# Altium schematic sheet A3P600_4Bit_CPU.SchDoc
size 589 x 419 mm; SheetNumber: 1; SheetTotal: 1
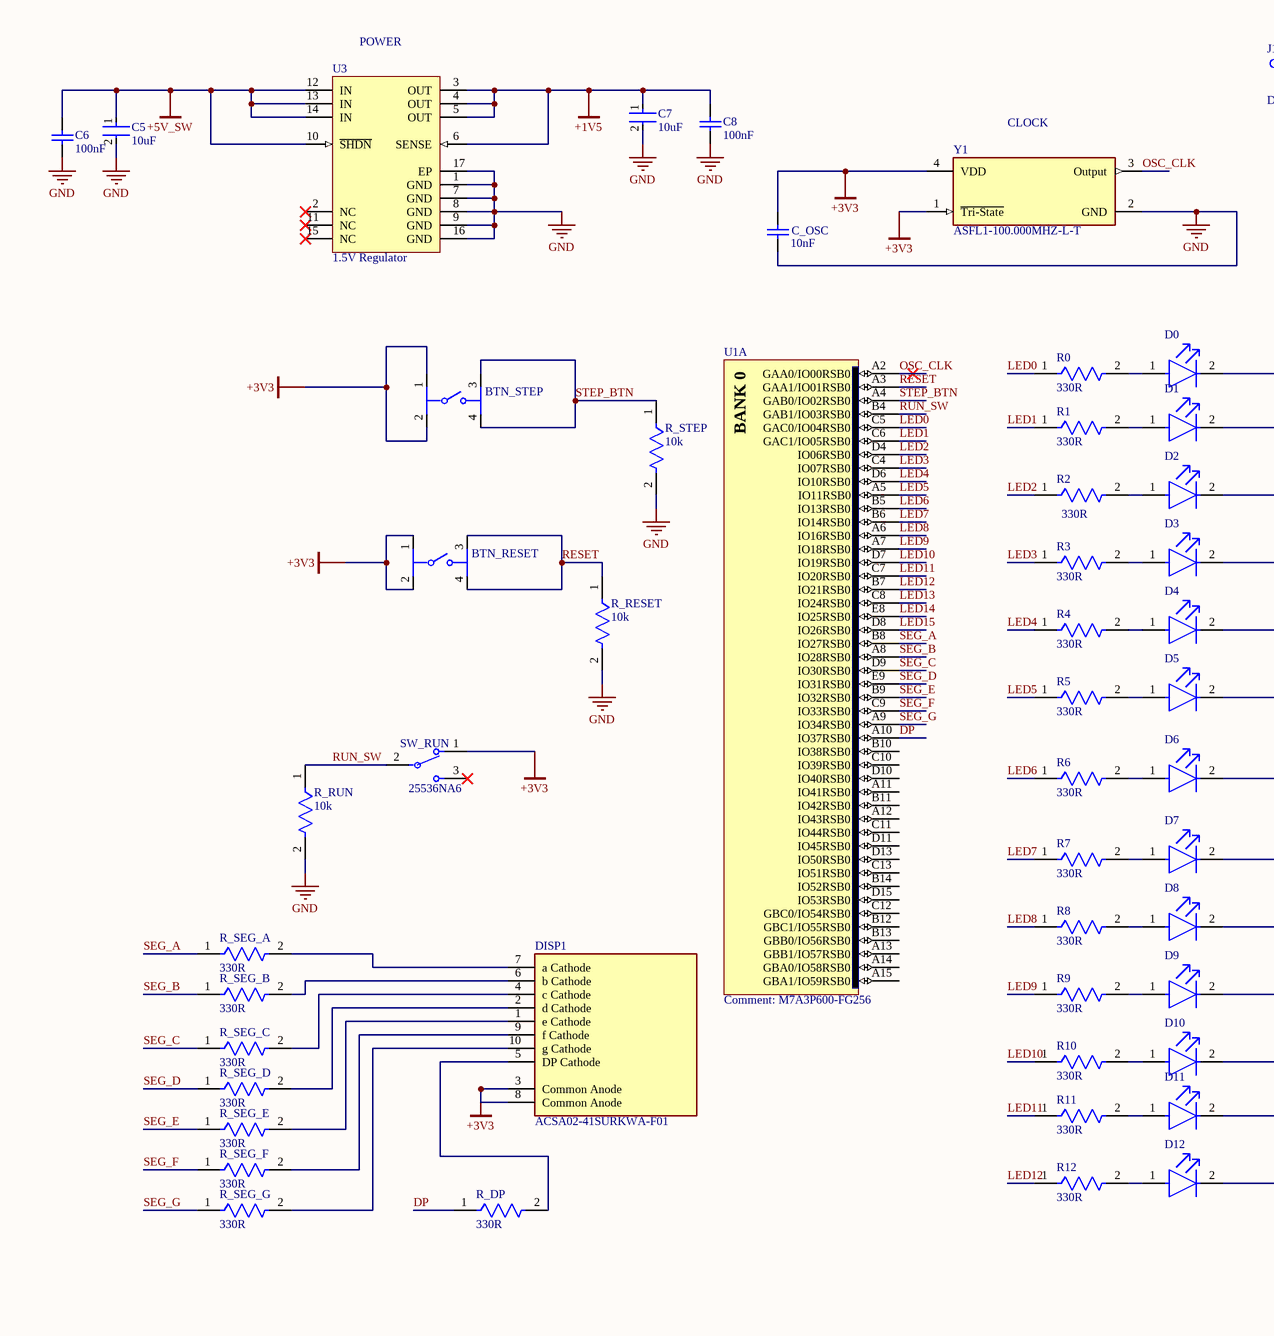
[diagram p0: A3P600_4Bit_CPU.SchDoc, left]
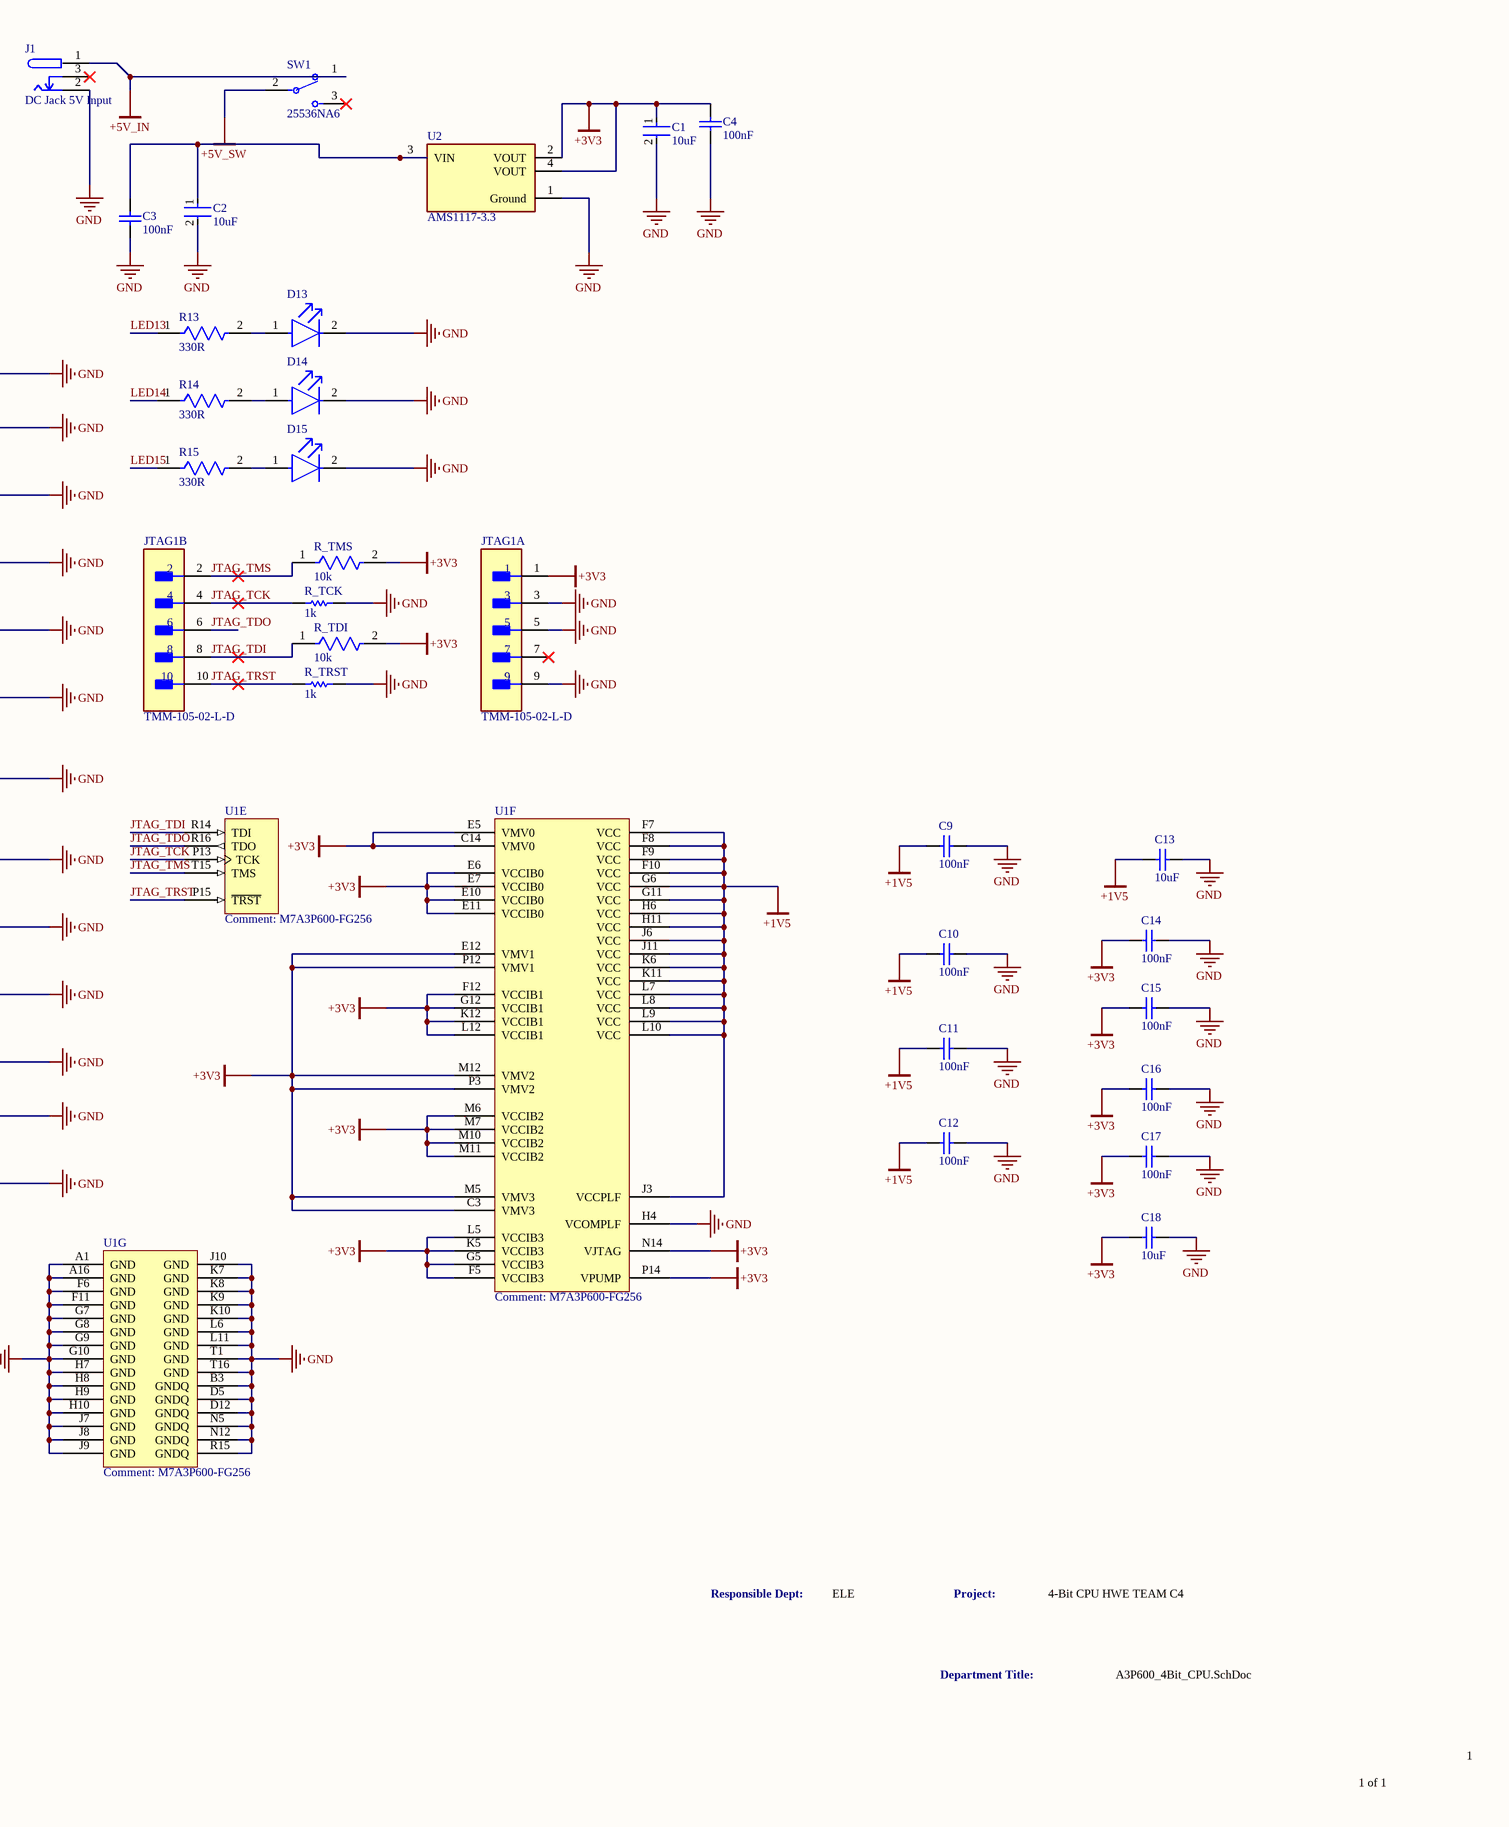
[diagram p1: A3P600_4Bit_CPU.SchDoc, right]

## Parts
BTN_RESET  B3W-1000  [FP-B3W-1000-MFG]  (value not drawn)
BTN_STEP  B3W-1000  [FP-B3W-1000-MFG]  (value not drawn)
C1  10uF  [FP-1206-L_3_2_0_3-W_1_6_0-IPC_B]
C2  10uF  [FP-1206-L_3_2_0_3-W_1_6_0-IPC_B]
C3  100nF  [CAPC2013X145X50NL20T25]
C4  100nF  [CAPC2013X145X50NL20T25]
C5  10uF  [FP-1206-L_3_2_0_3-W_1_6_0-IPC_B]
C6  100nF  [CAPC2013X145X50NL20T25]
C7  10uF  [FP-1206-L_3_2_0_3-W_1_6_0-IPC_B]
C8  100nF  [CAPC2013X145X50NL20T25]
C9  100nF  [CAPC0805(2012)100_L]
C10  100nF  [CAPC0805(2012)100_L]
C11  100nF  [CAPC0805(2012)100_L]
C12  100nF  [CAPC0805(2012)100_L]
C13  10uF  [CAPC2013X140X50LL20T25]
C14  100nF  [CAPC0805(2012)100_L]
C15  100nF  [CAPC0805(2012)100_L]
C16  100nF  [CAPC0805(2012)100_L]
C17  100nF  [CAPC0805(2012)100_L]
C18  10uF  [CAPC2013X140X50LL20T25]
C_OSC  10nF  [CAPC2013X94X50ML20T25]
D0  SML-LX0805SRC-TR  [FP-SML-LX0805SRC-TR-MFG]  (value not drawn)
D1  SML-LX0805SRC-TR  [FP-SML-LX0805SRC-TR-MFG]  (value not drawn)
D2  SML-LX0805SRC-TR  [FP-SML-LX0805SRC-TR-MFG]  (value not drawn)
D3  SML-LX0805SRC-TR  [FP-SML-LX0805SRC-TR-MFG]  (value not drawn)
D4  SML-LX0805SRC-TR  [FP-SML-LX0805SRC-TR-MFG]  (value not drawn)
D5  SML-LX0805SRC-TR  [FP-SML-LX0805SRC-TR-MFG]  (value not drawn)
D6  SML-LX0805SRC-TR  [FP-SML-LX0805SRC-TR-MFG]  (value not drawn)
D7  SML-LX0805SRC-TR  [FP-SML-LX0805SRC-TR-MFG]  (value not drawn)
D8  SML-LX0805SRC-TR  [FP-SML-LX0805SRC-TR-MFG]  (value not drawn)
D9  SML-LX0805SRC-TR  [FP-SML-LX0805SRC-TR-MFG]  (value not drawn)
D10  SML-LX0805SRC-TR  [FP-SML-LX0805SRC-TR-MFG]  (value not drawn)
D11  SML-LX0805SRC-TR  [FP-SML-LX0805SRC-TR-MFG]  (value not drawn)
D12  SML-LX0805SRC-TR  [FP-SML-LX0805SRC-TR-MFG]  (value not drawn)
D13  SML-LX0805SRC-TR  [FP-SML-LX0805SRC-TR-MFG]  (value not drawn)
D14  SML-LX0805SRC-TR  [FP-SML-LX0805SRC-TR-MFG]  (value not drawn)
D15  SML-LX0805SRC-TR  [FP-SML-LX0805SRC-TR-MFG]  (value not drawn)
DISP1  ACSA02-41SURKWA-F01  [FP-ACSA02-41SURKWA-F01-MFG]
J1  DC Jack 5V Input  [FP-PJ-102A-MFG]
JTAG1  TMM-105-02-L-D  [FP-TMM-105-02-L-D-MFG]  (parts A,B of 2)
R0  330R  [FP-CRCW0805-e3-IPC_C]
R1  330R  [FP-CRCW0805-e3-IPC_C]
R2  330R  [FP-CRCW0805-e3-IPC_C]
R3  330R  [FP-CRCW0805-e3-IPC_C]
R4  330R  [FP-CRCW0805-e3-IPC_C]
R5  330R  [FP-CRCW0805-e3-IPC_C]
R6  330R  [FP-CRCW0805-e3-IPC_C]
R7  330R  [FP-CRCW0805-e3-IPC_C]
R8  330R  [FP-CRCW0805-e3-IPC_C]
R9  330R  [FP-CRCW0805-e3-IPC_C]
R10  330R  [FP-CRCW0805-e3-IPC_C]
R11  330R  [FP-CRCW0805-e3-IPC_C]
R12  330R  [FP-CRCW0805-e3-IPC_C]
R13  330R  [FP-CRCW0805-e3-IPC_C]
R14  330R  [FP-CRCW0805-e3-IPC_C]
R15  330R  [FP-CRCW0805-e3-IPC_C]
R_DP  330R  [FP-RT0805-MFG]
R_RESET  10k  [FP-CRGP0805-IPC_C]
R_RUN  10k  [FP-CRGCQ1206-IPC_C]
R_SEG_A  330R  [FP-RT0805-MFG]
R_SEG_B  330R  [FP-RT0805-MFG]
R_SEG_C  330R  [FP-RT0805-MFG]
R_SEG_D  330R  [FP-RT0805-MFG]
R_SEG_E  330R  [FP-RT0805-MFG]
R_SEG_F  330R  [FP-RT0805-MFG]
R_SEG_G  330R  [FP-RT0805-MFG]
R_STEP  10k  [FP-CRGP0805-IPC_C]
R_TCK  1k  [RESC2013X50X30ML20T20]
R_TDI  10k  [FP-CRGP0805-IPC_C]
R_TMS  10k  [FP-CRGP0805-IPC_C]
R_TRST  1k  [RESC2013X50X30ML20T20]
SW1  25536NA6  [FP-25536NA6-0]
SW_RUN  25536NA6  [FP-25536NA6-0]
U1  M7A3P600-FG256  [FG256]  (parts A,E,F,G of 7)
U2  AMS1117-3.3  [FP-AMS1117-IPC_C]
U3  1.5V Regulator  [LT-FE-16-EPV-BB_L]
Y1  ASFL1-100.000MHZ-L-T  [FP-ASFL1-MFG]

## Nets
+1V5: C7.1 C8.1 C9.1 C10.1 C11.1 C12.2 C13.1 U1.F7(VCC) U1.F8(VCC) U1.F9(VCC) U1.F10(VCC) U1.G6(VCC) U1.G11(VCC) U1.H6(VCC) U1.H11(VCC) U1.J3(VCCPLF) U1.J6(VCC) U1.J11(VCC) U1.K6(VCC) U1.K11(VCC) U1.L7(VCC) U1.L8(VCC) U1.L9(VCC) U1.L10(VCC) U3.3(OUT) U3.4(OUT) U3.5(OUT) U3.6(SENSE)
+3V3: BTN_RESET.1 BTN_RESET.2 BTN_STEP.1 BTN_STEP.2 C1.1 C4.2 C14.1 C15.1 C16.1 C17.1 C18.1 C_OSC.1 DISP1.3(Common_Anode) DISP1.8(Common_Anode) JTAG1.1 R_TDI.2 R_TMS.2 SW_RUN.1 U1.C3(VMV3) U1.C14(VMV0) U1.E5(VMV0) U1.E6(VCCIB0) U1.E7(VCCIB0) U1.E10(VCCIB0) U1.E11(VCCIB0) U1.E12(VMV1) U1.F5(VCCIB3) U1.F12(VCCIB1) U1.G5(VCCIB3) U1.G12(VCCIB1) U1.K5(VCCIB3) U1.K12(VCCIB1) U1.L5(VCCIB3) U1.L12(VCCIB1) U1.M5(VMV3) U1.M6(VCCIB2) U1.M7(VCCIB2) U1.M10(VCCIB2) U1.M11(VCCIB2) U1.M12(VMV2) U1.N14(VJTAG) U1.P3(VMV2) U1.P12(VMV1) U1.P14(VPUMP) U2.2(VOUT) U2.4(VOUT) Y1.1(~{Tri-State}) Y1.4(VDD)
+5V_IN: J1.1 SW1.1
+5V_SW: C5.1 C6.1 SW1.2 U3.10(~{SHDN}) U3.12(IN) U3.13(IN) U3.14(IN)
GND: C1.2 C2.2 C3.2 C4.1 C5.2 C6.2 C7.2 C8.2 C9.2 C10.2 C11.2 C12.1 C13.2 C14.2 C15.2 C16.2 C17.2 C18.2 C_OSC.2 D0.2(C) D1.2(C) D2.2(C) D3.2(C) D4.2(C) D5.2(C) D6.2(C) D7.2(C) D8.2(C) D9.2(C) D10.2(C) D11.2(C) D12.2(C) D13.2(C) D14.2(C) D15.2(C) J1.2 JTAG1.3 JTAG1.5 JTAG1.9 R_RESET.2 R_RUN.2 R_STEP.2 R_TCK.2 R_TRST.2 U1.A1(GND) U1.A16(GND) U1.B3(GNDQ) U1.D5(GNDQ) U1.D12(GNDQ) U1.F6(GND) U1.F11(GND) U1.G7(GND) U1.G8(GND) U1.G9(GND) U1.G10(GND) U1.H4(VCOMPLF) U1.H7(GND) U1.H8(GND) U1.H9(GND) U1.H10(GND) U1.J7(GND) U1.J8(GND) U1.J9(GND) U1.J10(GND) U1.K7(GND) U1.K8(GND) U1.K9(GND) U1.K10(GND) U1.L6(GND) U1.L11(GND) U1.N5(GNDQ) U1.N12(GNDQ) U1.R15(GNDQ) U1.T1(GND) U1.T16(GND) U2.1(Ground) U3.1(GND) U3.7(GND) U3.8(GND) U3.9(GND) U3.16(GND) U3.17(EP) Y1.2(GND)
DP: R_DP.1 U1.A10(IO37RSB0)
JTAG_TCK: JTAG1.4 R_TCK.1 U1.P13(TCK)
JTAG_TDI: JTAG1.8 R_TDI.1 U1.R14(TDI)
JTAG_TDO: JTAG1.6 U1.R16(TDO)
JTAG_TMS: JTAG1.2 R_TMS.1 U1.T15(TMS)
JTAG_TRST: JTAG1.10 R_TRST.1 U1.P15(~{TRST})
LED0: R0.1 U1.C5(GAC0/IO04RSB0)
LED1: R1.1 U1.C6(GAC1/IO05RSB0)
LED2: R2.1 U1.D4(IO06RSB0)
LED3: R3.1 U1.C4(IO07RSB0)
LED4: R4.1 U1.D6(IO10RSB0)
LED5: R5.1 U1.A5(IO11RSB0)
LED6: R6.1 U1.B5(IO13RSB0)
LED7: R7.1 U1.B6(IO14RSB0)
LED8: R8.1 U1.A6(IO16RSB0)
LED9: R9.1 U1.A7(IO18RSB0)
LED10: R10.1 U1.D7(IO19RSB0)
LED11: R11.1 U1.C7(IO20RSB0)
LED12: R12.1 U1.B7(IO21RSB0)
LED13: R13.1 U1.C8(IO24RSB0)
LED14: R14.1 U1.E8(IO25RSB0)
LED15: R15.1 U1.D8(IO26RSB0)
OSC_CLK: U1.A2(GAA0/IO00RSB0) Y1.3(Output)
RESET: BTN_RESET.3 BTN_RESET.4 R_RESET.1 U1.A3(GAA1/IO01RSB0)
RUN_SW: R_RUN.1 SW_RUN.2 U1.B4(GAB1/IO03RSB0)
SEG_A: R_SEG_A.1 U1.B8(IO27RSB0)
SEG_B: R_SEG_B.1 U1.A8(IO28RSB0)
SEG_C: R_SEG_C.1 U1.D9(IO30RSB0)
SEG_D: R_SEG_D.1 U1.E9(IO31RSB0)
SEG_E: R_SEG_E.1 U1.B9(IO32RSB0)
SEG_F: R_SEG_F.1 U1.C9(IO33RSB0)
SEG_G: R_SEG_G.1 U1.A9(IO34RSB0)
STEP_BTN: BTN_STEP.3 BTN_STEP.4 R_STEP.1 U1.A4(GAB0/IO02RSB0)
NetC2_1: C2.1 C3.1 U2.3(VIN)
NetD0_1: D0.1(A) R0.2
NetD1_1: D1.1(A) R1.2
NetD2_1: D2.1(A) R2.2
NetD3_1: D3.1(A) R3.2
NetD4_1: D4.1(A) R4.2
NetD5_1: D5.1(A) R5.2
NetD6_1: D6.1(A) R6.2
NetD7_1: D7.1(A) R7.2
NetD8_1: D8.1(A) R8.2
NetD9_1: D9.1(A) R9.2
NetD10_1: D10.1(A) R10.2
NetD11_1: D11.1(A) R11.2
NetD12_1: D12.1(A) R12.2
NetD13_1: D13.1(A) R13.2
NetD14_1: D14.1(A) R14.2
NetD15_1: D15.1(A) R15.2
NetDISP1_1: DISP1.1(e_Cathode) R_SEG_E.2
NetDISP1_2: DISP1.2(d_Cathode) R_SEG_D.2
NetDISP1_4: DISP1.4(c_Cathode) R_SEG_C.2
NetDISP1_5: DISP1.5(DP_Cathode) R_DP.2
NetDISP1_6: DISP1.6(b_Cathode) R_SEG_B.2
NetDISP1_7: DISP1.7(a_Cathode) R_SEG_A.2
NetDISP1_9: DISP1.9(f_Cathode) R_SEG_F.2
NetDISP1_10: DISP1.10(g_Cathode) R_SEG_G.2

Not connected (* = marked no-connect by the designer): J1 3*; JTAG1 7*; SW1 3*; SW_RUN 3*; U1 A11(IO41RSB0) A12(IO43RSB0) A13(GBB1/IO57RSB0) A14(GBA0/IO58RSB0) A15(GBA1/IO59RSB0) B10(IO38RSB0) B11(IO42RSB0) B12(GBC1/IO55RSB0) B13(GBB0/IO56RSB0) B14(IO52RSB0) C10(IO39RSB0) C11(IO44RSB0) C12(GBC0/IO54RSB0) C13(IO51RSB0) D10(IO40RSB0) D11(IO45RSB0) D13(IO50RSB0) D15(IO53RSB0); U3 2(NC)* 11(NC)* 15(NC)*

## Notes on the sheet
- (near U3) POWER
- (near Y1) CLOCK
- Responsible Dept:
- ELE
- Project:
- 4-Bit CPU HWE TEAM C4
- Department Title:
- A3P600_4Bit_CPU.SchDoc
- 1 of 1
- 1
- (in symbol CMP-0097-00122-1, part A) BANK 0

## Library data of the parts
BTN_RESET BTN_STEP = CMP-08834-000045-1: SWITCH TACTILE SPST-NO 0.05A 24V; Actuator Color: White; Actuator Type: Standard; Current Rating: 50mA; Ratings: IP67; Number of Poles: 1; Illumination Type: Non-Illuminated; Actuator Length: 0.9mm; Switch Function: Off-Mom; Mechanical Life: 1000000Cycles; Throw Configuration: SPST; Operating Force: 1.57N; Contact Resistance: 100mR; Switch Travel: 0.25mm; Mount: Through Hole; Orientation: Straight; Termination: PC Pins; Series: B3W; Max Operating Temperature: 70°C; Contact Plating: Silver; Max Current Rating: 50mA; RoHS Compliant: Yes; Packaging: Bulk; Contact Material: Silver; Length: 6.6mm; Voltage Rating (DC): 24V; Min Operating Temperature: -25°C; Radiation Hardening: No; Package Quantity: 100; Depth: 6.6mm; Max Voltage Rating (DC): 24V; Weight: 0.3g; Insulation Resistance: 100MR; Contact Current Rating: 50mA
C1 C2 C5 C7 = CMP-2000-07359-3: None; Voltage Rating: 50V; Tolerance: 20%; Dielectric: X5R; Package Quantity: 2000; Capacitance: 10uF; Min Operating Temperature: -55°C; Halogen Free: Halogen Free; Width: 0.063inch; Case Code (Imperial): 1206; RoHS Compliant: Yes; Packaging: Tape and Reel; Case Code (Metric): 3216; Height: 1.6mm; Construction: Flat; Length: 0.126inch; Thickness: 0.075inch; Termination: SMD/SMT; Mount: Surface Mount; Series: M; Case/Package: 1206; Voltage Rating (DC): 50V; Max Operating Temperature: 85°C
C3 C4 C6 C8 = CMP-2007-01227-1: Manufacturer: Kemet; Part Number: C0805S104K5RACTU
C9-C12 C14-C17 = CMP-1036-04418-1: CAP 100nF 50V ±5% 0805 (2012 Metric) Thickness 1mm SMD; Case-EIA: 0805; Tolerance: Â±5%; Case-Metric: 2012; Max Thickness: 1 mm; Technology: SMT; Value: 100nF; Rated Voltage: 50 V
C13 C18 = CMP-1036-04929-2: Part Number: 0805YD106MAT2A; Manufacturer: AVX Interconnect / Elco
C_OSC = CMP-2007-04168-1: Manufacturer: AVX Interconnect / Elco; Part Number: 08051C103KAT4A
D0-D15 = CMP-57192-000013-1: LED RED CLEAR SMD; Forward Current: 20mA; Wavelength: 660nm; Forward Voltage: 1.7V; Luminous Intensity: 25mcd; Number of LEDs: 1; Current Rating: 25mA; Lens Color: Colorless; Power Rating: 100mW; Viewing Angle: 140°; Approvals: UL; Lens Transparency: Clear; Series: -; Package Quantity: 3000; Mount: Surface Mount; Lead Free: Lead Free; Case/Package: 0805; Max Operating Temperature: 85°C; Illumination Color: Red; Packaging: Tape and Reel; Length: 2mm; Lens Style: Clear; Width: 1.25mm; RoHS Compliant: Yes; Color: Red; Case Code (Metric): 2012; Dominant Wavelength: 660nm; Number of Pins: 2; Min Operating Temperature: -40°C; Case Code (Imperial): 0805; Voltage Rating (DC): 1.7V; Voltage Rating: 1.7V; Height: 1.2mm; Test Current: 20mA
DISP1 = CMP-44525-000003-1: DISPLAY 7-SEG 0.2" SGL RED 10SMD; Element Configuration: Common Anode; Forward Current: 30mA; Wavelength: 630nm; Operating Supply Voltage: 1.95V; Number of Characters: 1; Max Power Dissipation: 75mW; Luminous Intensity: 30mcd; Test Current: 20mA; Package Quantity: 650; Width: 0.272inch; Max Operating Temperature: 85°C; Case/Package: SMD/SMT; Illumination Color: Red; Min Operating Temperature: -40°C; Packaging: Tape and Reel; Power Consumption: 75mW; Forward Voltage: 1.95V; Color: Red; Height: 0.315inch
J1 = CMP-12637-106234071-1: PJ-102A 2.0 x 6.5 mm, 2.5 A, Horizontal, Through Hole, Tapered Pins, Dc Power Jack Connector; Voltage Rating (DC): 24V; Number of Contacts: 3; Outside Diameter: 6.5mm; Gender: Male; Shielding: No; Insulation Resistance: 50MΩ; Current Rating: 2.5A; Inside Diameter: 2mm; Number of Conductors: 2; Housing Color: Black; RoHS: Compliant; Diameter: 2.1mm; Mount: Through Hole; Contact Plating: Nickel; NexarPartId: 106234071; Voltage Rating: 24V; Housing Material: Thermoplastic; Max Operating Temperature: 85°C; Color: Black; Contact Material: Copper, Nickel, Tin; Orientation: Horizontal; Packaging: Bulk; Flammability Rating: UL94 V-0; Schedule B: 8536695050, 8536695050; Contact Gender: Male; Lead Free: Lead Free; Termination: Through Hole; Min Operating Temperature: -25°C; Height: 11.2mm; Lifecycle Status: Production
JTAG1 = CMP-02766-001571-1: CONN HEADER VERT 10POS 2MM; Max Voltage Rating (AC): 500V; Max Current Rating: 3.9A; Number of Positions: 10; Gender: Male; Radiation Hardening: No; Fastening Type: Pull; Housing Color: Black; Max Operating Temperature: 125°C; Number of Rows: 2; Series: TMM; Orientation: Straight; Insulation Color: Black; Contact Plating: Gold; Packaging: Bulk; Housing Material: Polymer; Contact Type: Male Pin; Contact Material: Bronze; Connector Type: Header; Termination: Solder; REACH SVHC: No SVHC; Contact Finish - Mating: GOLD; RoHS Compliant: Yes; Depth: 3.94mm; Min Operating Temperature: -55°C; Insulation Material: Polymer; Contact Shape: Square; Pitch: 2mm; Number of Contacts: 10; Length: 10mm; Lead Free: Lead Free
R0-R15 = CMP-2001-03824-2: RES Thick Film, 330Ω, 5%, 0.125W, 200ppm/°C, 0805; Power Rating: 125mW; Voltage Rating (DC): 150V; Case Code (Imperial): 0805; Temperature Coefficient: 200ppm/°C; Military Standard: Not; Tolerance: 5%; Max Power Dissipation: 125mW; Composition: Thick Film; Height: 0.02inch; Depth: 1.25mm; Termination: SMD/SMT; Voltage Rating: 150V; Max Operating Temperature: 155°C; Min Operating Temperature: -55°C; Number of Terminations: 2; Packaging: Tape and Reel; Radiation Hardening: No; Case/Package: 0805; Resistance: 330R; Lead Free: Lead Free; Package Quantity: 1; Contact Plating: Tin; Length: 2mm; Case Code (Metric): 2012; Features: Automotive AEC-Q200; Weight: 0.000194oz; Width: 0.049inch
R_DP R_SEG_A R_SEG_B R_SEG_C R_SEG_D R_SEG_E R_SEG_F R_SEG_G = CMP-2001-01631-2: RES 330 OHM 1/8W .1% SMD 0805; Manufacturer: Yageo; Manufacturer Part Number: RT0805BRD07330RL; Resistance: 330Ω; Temperature Coefficient: 25 ppm/°C; Value: 330Ω; Voltage Rating: 150V; Tolerance: 0.0025; Power Rating: 0.125W; Device Class L3: Chip SMD Resistors; Footprint Url: http://www.yageo.com/exep/pages/download/literatures/PYu-R_Mount_10.pdf; Device Class L2: Resistors; Series: RT; ComponentLink2Description: Datasheet; Automotive: No; Mouser Description: Thin Film Resistors - SMD 1/8W 330 ohm .1% 25ppm; Device Class L1: Passive Components; Digikey Description: RES 330 OHM 1/8W .1% SMD 0805; Ipc Land Pattern Name: RESC200125X50; Composition: Thin Film; Height: 0.6mm; RoHS: TRUE; Temperature: -55°C to +155°C; Category: Res; Package: RT0805; Octopart: https://octopart.com/rt0805brd07330rl-yageo-1374790; Temperature Range High: +155°C; ComponentLink2URL: http://www.yageo.com/documents/recent/PYu-RT_1-to-0.01_RoHS_L_9.pdf; Lead Free: Yes; Temperature Range Low: -55°C
R_RESET R_TDI R_TMS = CMP-03211-006861-1: CRGP 0805 10K 1%; Manufacturer Part Number: CRGP0805F10K; Manufacturer: TE; Power Rating: 0.33W; Voltage Rating: 150V; Value: 10KΩ; Tolerance: 0.01; Temperature Coefficient: ±100ppm/°C; ComponentLink2URL: https://www.mouser.com/datasheet/2/418/NG_DS_9-1773463-9_A-1358566.pdf; Temperature Range Low: -55°C; Ipc Land Pattern Name: RESC200125X55; Device Class L2: Resistors; Automotive: No; Device Class L3: Chip SMD Resistors; Composition: Thick Film; Temperature Range High: +155°C; Temperature: -55°C to +155°C; Height: 0.65mm; Series: CRGP; RoHS: TRUE; Device Class L1: Passive Components; Octopart: https://octopart.com/crgp0805f10k-te+connectivity-91018782; Package: CRGP0805; Digikey Description: CRGP 0805 10K 1%; Ambient Temperature Range High: +70°C; Lead Free: Yes; ComponentLink2Description: Datasheet; Category: Res; Resistance: 10KΩ
R_RUN = CMP-03211-010884-1: CRGCQ1206 10KΩ 0.25W 1% ±100ppm/°C 200V; Manufacturer: TE Connectivity; Manufacturer Part Number: CRGCQ1206F10K; Tolerance: 0.01; Automotive Grade: Grade 913; Value: 10KΩ; Automotive: Yes; Temperature: -55°C to +155°C; RoHS: TRUE; Series: CRGCQ; Lead Free: Yes; Device Class L3: Chip SMD Resistors; Package: CRGCQ1206; ComponentLink2URL: https://www.te.com/commerce/DocumentDelivery/DDEController?Action=showdoc&DocId=Data+Sheet%7F1773204-3%7F1%7Fpdf%7FEnglish%7FENG_DS_1773204-3_1.pdf%7F4-2176347-922; Ipc Land Pattern Name: RESC310155X55; Composition: Thick Film; Voltage Rating: 200V; Device Class L1: Passive Components; Temperature Range Low: -55°C; Resistance: 10KΩ; Height: 0.65mm; Power Rating: 0.25W; Device Class L2: Resistors; Temperature Range High: +155°C; Octopart: https://octopart.com/crgcq1206f10k-te+connectivity-91018244; Ambient Temperature Range High: +70°C; ComponentLink2Description: Datasheet; Temperature Coefficient: ±100ppm/°C; Category: Res
R_STEP = CMP-03211-006861-1: Manufacturer Part Number: CRGP0805F10K; Manufacturer: TE; Power Rating: 0.33W; Voltage Rating: 150V; Value: 10KΩ; Tolerance: 0.01; Temperature Coefficient: ±100ppm/°C; ComponentLink2URL: https://www.mouser.com/datasheet/2/418/NG_DS_9-1773463-9_A-1358566.pdf; Temperature Range Low: -55°C; Ipc Land Pattern Name: RESC200125X55; Device Class L2: Resistors; Automotive: No; Device Class L3: Chip SMD Resistors; Composition: Thick Film; Temperature Range High: +155°C; Temperature: -55°C to +155°C; Height: 0.65mm; Series: CRGP; RoHS: TRUE; Device Class L1: Passive Components; Octopart: https://octopart.com/crgp0805f10k-te+connectivity-91018782; Package: CRGP0805; Digikey Description: CRGP 0805 10K 1%; Ambient Temperature Range High: +70°C; Lead Free: Yes; ComponentLink2Description: Datasheet; Category: Res; Resistance: 10KΩ
R_TCK R_TRST = CMP-2001-04268-1: Manufacturer: Vishay Dale; Part Number: CRCW08051K00FKTC
SW1 SW_RUN = CMP-47022-000007-1: SWITCH SLIDE SPDT 4A 125V; Current Rating: 1A; Voltage Rating (DC): 30V; Mechanical Life: 20000Cycles; Contact Resistance: 10mR; Electrical Life: 10000Cycles; Switch Function: On-On; Actuator Material: Nylon; Actuator Length: 6mm; Illumination Type: Non-Illuminated; Switch Travel: 4mm; Actuator Type: Standard; Max Voltage Rating (AC): 250V; Min Operating Temperature: -40°C; Max Voltage Rating (DC): 30V; Contact Current Rating: 4A; Series: 25000N; Termination: PC Pin; Orientation: Right Angle; Contact Plating: Silver; Throw Configuration: SPDT; Max Operating Temperature: 85°C; Contact Material: Silver; Packaging: Bulk; Mount: Through Hole; Voltage Rating (AC): 125V; Package Quantity: 100
U1 = CMP-0097-00122-1: M7-Ready ProASIC3 Flash Family FPGA, 177 User IOs, 600K System Gates, 108 Kbits RAM, 1 Kbit Flash ROM, 1 PLL, 256-Ball FBGA, Commercial Grade; ComponentAvailability: F speed grade removed in ver1.3, Oct-2009 datasheet.; PackageDescription: 256-Ball Fine Pitch Plastic Ball Grid Array 1.00 mm Pitch (FG256); Code_JEDEC: MO-192-DAF-1; DatasheetVersion: v1.1, Feb-2009; PackageVersion: ver11.2, Nov-2009; PackageReference: FG256
U2 = CMP-209535-000001-1: LDO Voltage Regulators 1A, 3.3V; Manufacturer: Advanced Monolithic Systems; Dropout Voltage: 1.1V; Output Type: Fixed; Nominal Supply Current: 5mA; Max Power Dissipation: 1.2W; Max Supply Voltage: 15V; Number Of Outputs: 1; Standoff Height: 0.64mm; Max Junction Temp: +125°C; Height: 1.8mm; Package: AMS1117; Device Class L2: Power Management ICs; ComponentLink2Description: Datasheet; ComponentLink2URL: http://www.advanced-monolithic.com/pdf/ds1117.pdf; Category: IC; RoHS: TRUE; Automotive: No; Device Class L1: Integrated Circuits (ICs); Output Current: 1A; Device Class L3: Voltage Regulators - Linear; Temperature: -40°C to +125°C; Output Voltage: 3.3V; Manufacturer Part Number: AMS1117-3.3; Temperature Range Low: -40°C; Octopart: https://octopart.com/ams1117-3.3-advanced+monolithic+systems-25899300; Lead Free: Yes; Ipc Land Pattern Name: SOT229P700X180-4; Temperature Range High: +125°C
U3 = CMP-0476-00499-1: 3 A, Fast Transient Response, Low Noise, LDO Regulator, 2.7 to 20 V Vin, 1.5 V Vout, 16-pin SOP (FE-16-EPV-BB), -40 to 125 degC, Pb-Free, Tape and Reel; PartNumber: LT1764AEFE-1.5#TRPBF; Manufacturer: Linear Technology; Shutdown Current(uA): 0.01; Discrete Pass Element: no; Number of Outputs: 1; Iout(mA): 3000; Dropout Voltage(V): 0.34; Noise(uV): 40; Vin Min(V): 2.7; PSRR(dB): 63; Vin Max(V): 20; Output Voltage: 1.5 V; Mounting Technology: Surface Mount; ComponentLink3Description: Package Specification; ComponentLink1Description: Manufacturer URL; DatasheetVersion: Rev. B; Packing: Tape and Reel; RoHS: TRUE; ComponentLink2URL: http://cds.linear.com/docs/en/datasheet/1764afb.pdf; PackageDescription: 16-Pin Plastic TSSOP, Body 5 x 4.4 mm, Pitch 0.65 mm; ComponentLink1URL: http://www.linear.com/; ComponentLink3URL: http://cds.linear.com/docs/en/packaging/05081663__J_FE16(BB).pdf; PackageVersion: Rev. J, 11/2012; Isupply(mA): 1; ComponentLink2Description: Datasheet; PackageReference: FE-16
Y1 = CMP-27762-001808-1: XTAL Oscillator 100MHz ±100ppm HCMOS, TTL 3.3V 4-SMD 5mm x 3.2mm; Max Supply Current: 85mA; Load Capacitance: 15pF; Depth: 3.2mm; Number of Pins: 4; Packaging: Tape and Reel; Height: 0.051inch; Radiation Hardening: No; Frequency Stability: 100ppm; Max Operating Temperature: 85°C; Operating Supply Voltage: 3.3V; Case/Package: SMD/SMT; Width: 0.126inch; Min Operating Temperature: -40°C; Frequency: 100MHz; Termination: SMD/SMT; Length: 0.197inch; Mount: Surface Mount; Series: ASFL1